# Altium schematic sheet Main.SchDoc
size A4; SheetNumber: 4; SheetTotal: 12
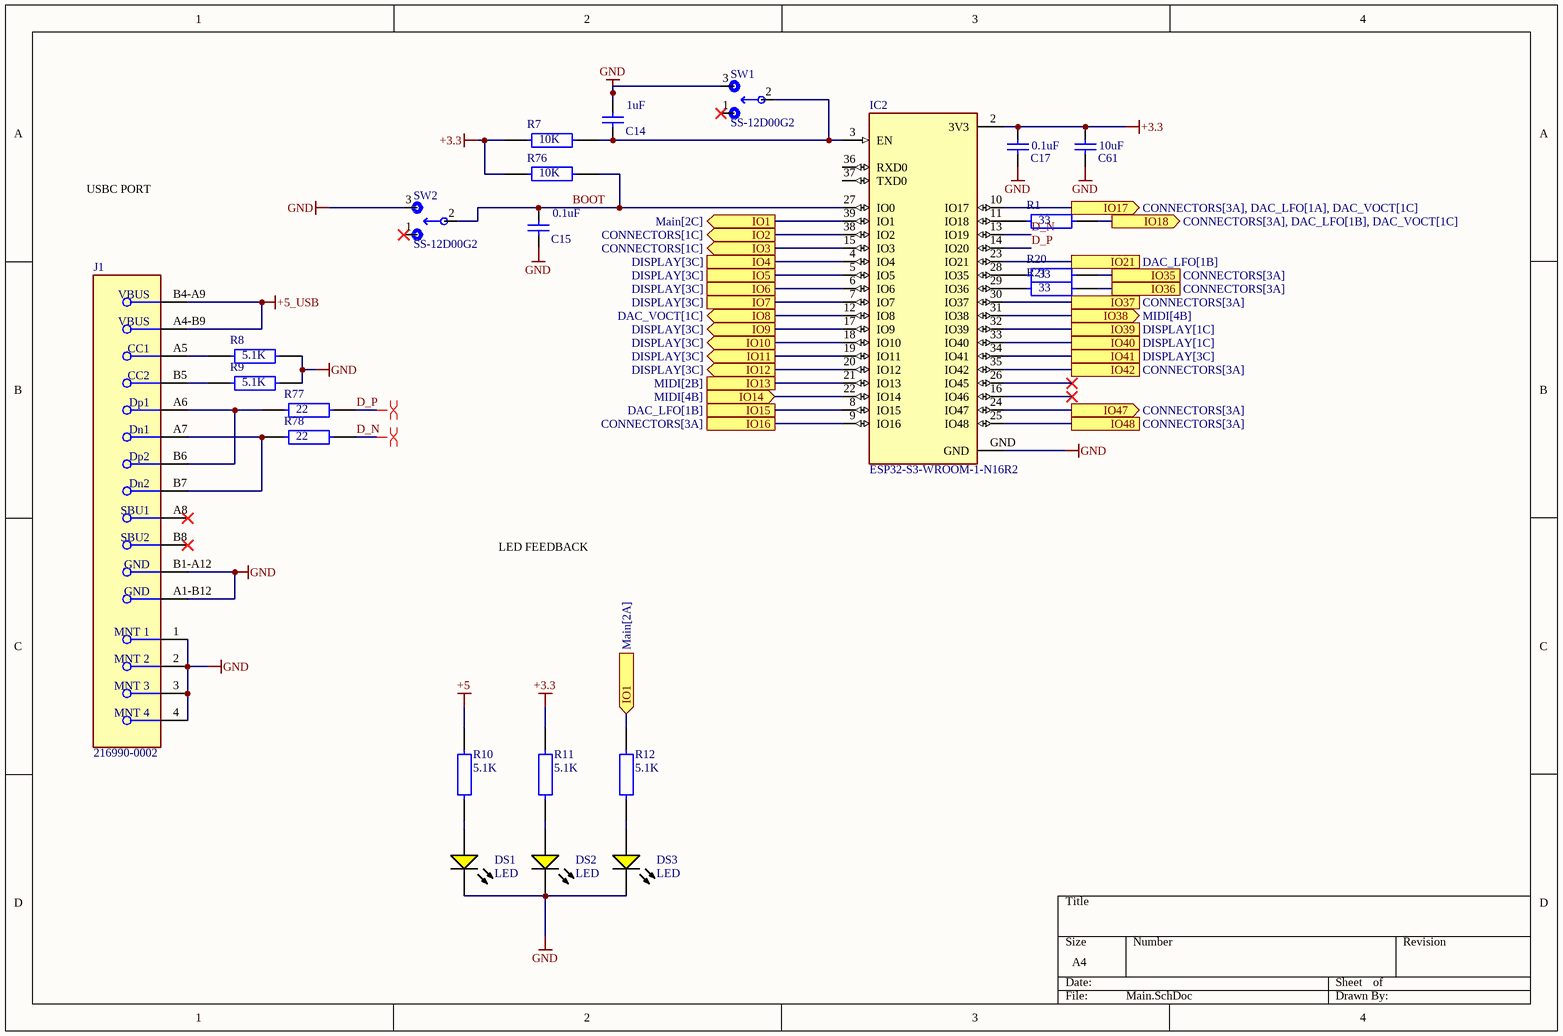
[diagram p0: Main.SchDoc]

## Parts
C14  1uF  [CAPC2013X145X48NL20T23]
C15  0.1uF  [CAPC2013X145X48NL20T23]
C17  0.1uF  [CAPC2013X145X48NL20T23]
C61  10uF  [CAPC2013X145X48NL20T23]
DS1  LED  [LED_0805]
DS2  LED  [LED_0805]
DS3  LED  [LED_0805]
IC2  ESP32-S3-WROOM-1-N16R2  [XCVR_ESP32-S3-WROOM-1-N16R2]
J1  216990-0002  [FP-216990-0002-MFG]
R1  33  [FP-RN73R2A-IPC_A]
R7  10K  [FP-RN73R2A-IPC_A]
R8  5.1K  [FP-RN73R2A-IPC_A]
R9  5.1K  [FP-RN73R2A-IPC_A]
R10  5.1K  [FP-RN73R2A-IPC_A]
R11  5.1K  [FP-RN73R2A-IPC_A]
R12  5.1K  [FP-RN73R2A-IPC_A]
R20  33  [FP-RN73R2A-IPC_A]
R21  33  [FP-RN73R2A-IPC_A]
R76  10K  [FP-RN73R2A-IPC_A]
R77  22  [FP-RN73R2A-IPC_A]
R78  22  [FP-RN73R2A-IPC_A]
SW1  SS-12D00G2  [SS12D00_SPDT]
SW2  SS-12D00G2  [SS12D00_SPDT]

## Ports
IO1 (in, see Main[2A]), IO1 (out, see Main[2C]), IO2 (out, see CONNECTORS[1C]), IO3 (out, see CONNECTORS[1C]), IO4 (see DISPLAY[3C]), IO5 (see DISPLAY[3C]), IO6 (see DISPLAY[3C]), IO7 (see DISPLAY[3C]), IO8 (out, see DAC_VOCT[1C]), IO9 (out, see DISPLAY[3C]), IO10 (out, see DISPLAY[3C]), IO11 (out, see DISPLAY[3C]), IO12 (out, see DISPLAY[3C]), IO13 (see MIDI[2B]), IO14 (in, see MIDI[4B]), IO15 (see DAC_LFO[1B]), IO16 (see CONNECTORS[3A]), IO17 (out, see CONNECTORS[3A], DAC_LFO[1A], DAC_VOCT[1C]), IO18 (out, see CONNECTORS[3A], DAC_LFO[1B], DAC_VOCT[1C]), IO21 (see DAC_LFO[1B]), IO35 (see CONNECTORS[3A]), IO36 (see CONNECTORS[3A]), IO37 (see CONNECTORS[3A]), IO38 (out, see MIDI[4B]), IO39 (see DISPLAY[1C]), IO40 (see DISPLAY[1C]), IO41 (see DISPLAY[3C]), IO42 (see CONNECTORS[3A]), IO47 (out, see CONNECTORS[3A]), IO48 (see CONNECTORS[3A])

## Nets
+3.3: C17.2 C61.2 IC2.2(3V3) R7.2 R11.1 R76.2
+5: R10.1
+5_USB: J1.A4-B9(VBUS) J1.B4-A9(VBUS)
GND: C14.2 C15.1 C17.1 C61.1 DS1.2(K) DS2.2(K) DS3.2(K) IC2.GND J1.1(MNT_1) J1.2(MNT_2) J1.3(MNT_3) J1.4(MNT_4) J1.A1-B12(GND) J1.B1-A12(GND) R8.1 R9.1 SW1.3 SW2.3
BOOT: C15.2 IC2.27(IO0) R76.1 SW2.2
D_N: IC2.13(IO19) R78.1
D_P: IC2.14(IO20) R77.1
IO1: IC2.39(IO1) R12.1 ; port IO1
IO2: IC2.38(IO2) ; port IO2
IO3: IC2.15(IO3) ; port IO3
IO4: IC2.4(IO4) ; port IO4
IO5: IC2.5(IO5) ; port IO5
IO6: IC2.6(IO6) ; port IO6
IO7: IC2.7(IO7) ; port IO7
IO8: IC2.12(IO8) ; port IO8
IO9: IC2.17(IO9) ; port IO9
IO10: IC2.18(IO10) ; port IO10
IO11: IC2.19(IO11) ; port IO11
IO12: IC2.20(IO12) ; port IO12
IO13: IC2.21(IO13) ; port IO13
IO14: IC2.22(IO14) ; port IO14
IO15: IC2.8(IO15) ; port IO15
IO16: IC2.9(IO16) ; port IO16
IO17: IC2.10(IO17) ; port IO17
IO18: R1.1 ; port IO18
IO21: IC2.23(IO21) ; port IO21
IO35: R20.1 ; port IO35
IO36: R21.1 ; port IO36
IO37: IC2.30(IO37) ; port IO37
IO38: IC2.31(IO38) ; port IO38
IO39: IC2.32(IO39) ; port IO39
IO40: IC2.33(IO40) ; port IO40
IO41: IC2.34(IO41) ; port IO41
IO42: IC2.35(IO42) ; port IO42
IO47: IC2.24(IO47) ; port IO47
IO48: IC2.25(IO48) ; port IO48
NetC14_1: C14.1 IC2.3(EN) R7.1 SW1.2
NetDS1_1: DS1.1(A) R10.2
NetDS2_1: DS2.1(A) R11.2
NetDS3_1: DS3.1(A) R12.2
NetIC2_11: IC2.11(IO18) R1.2
NetIC2_28: IC2.28(IO35) R20.2
NetIC2_29: IC2.29(IO36) R21.2
NetJ1_A5: J1.A5(CC1) R8.2
NetJ1_A6: J1.A6(Dp1) J1.B6(Dp2) R77.2
NetJ1_A7: J1.A7(Dn1) J1.B7(Dn2) R78.2
NetJ1_B5: J1.B5(CC2) R9.2

Not connected (* = marked no-connect by the designer): IC2 16(IO46)* 26(IO45)* 36(RXD0) 37(TXD0); J1 A8(SBU1)* B8(SBU2)*; SW1 1*; SW2 1*

## Layout directives
differential pair: D_N, D_P

## Notes on the sheet
- USBC PORT
- LED FEEDBACK

## Library data of the parts
C14 C15 C17 C61 = CAP: Manufacturer: Vitramon; Part Number: VJ0805Y682KXAMT
DS1-DS3 = CMP-1674-00012-1: Through Hole Lamp, 2.1 V, -55 to 100 degC, 2-Pin THD, RoHS, Bulk; Luminous Intensity: 200 mcd; Illumination Colour: White; Power Rating: 78 mW; Viewing Angle: 140 degrees; Lens Style: Diffused; Nominal Vf: 3.6 V; Case\Package: 0603; Forward Current: 20 mA; Colour: White; Pins: 2; Mount: Surface Mount; Min Operating Temperature: -40 degC; Radiation Hardening: No; Width: 0.8 mm; PackageDescription: 2-Pin Through Hole Device, Dia 3.8 mm, Pitch 2.54 mm; REACH SVHC: No SVHC; DatasheetVersion: Rev. B, 07/2013; Max Operating Temperature: 85 degC; PackageReference: LTL-1CHYE; ComponentLink2URL: https://datasheet.ciiva.com/4269/s-110-ltl-1chye-4269126.pdf; ComponentLink1URL: http://www.us.liteon.com/; Case Code (Imperial): 0603; Height: 0.6 mm; Packaging: Tape and Reel; ComponentLink2Description: Datasheet; Length: 1.6 mm; Package Quantity: 4000; RoHSCompliant: true; ComponentLink1Description: Manufacturer URL; Case Code (Metric): 1608; Forward Voltage: 3.6 V
IC2 = ESP32-S3-WROOM-1-N16R2: Bluetooth, WiFi 802.11b/g/n, Bluetooth v5.0 Transceiver Module 2.4GHz PCB Trace Surface Mount; MF: Espressif Systems; MP: ESP32S3WROOM1N16R2; SnapEDA_Link: https://www.snapeda.com/parts/ESP32S3WROOM1N16R2/Espressif+Systems/view-part/?ref=snap; Package: NON STANDARD Espressif Systems; Value: *; Check_prices: https://www.snapeda.com/parts/ESP32S3WROOM1N16R2/Espressif+Systems/view-part/?ref=eda
J1 = USBC16: CONN RCP USB2.0 TYP C 24P SMD RA
R1 R7-R12 R20 R21 R76-R78 = Resistor: RES 10K OHM 0.1% 1/8W 0805
SW1 SW2 = Switch: Switch Slide ON ON SPDT Side Slide 0.1A 12VDC 10000Cycles PC Pins Bracket Mount/Through Hole Bulk; MF: Littelfuse/C&K; MP: OS102011MA1QN1; SnapEDA_Link: https://www.snapeda.com/parts/OS102011MA1QN1/Littelfuse/view-part/?ref=snap; Package: None; Value: *; Check_prices: https://www.snapeda.com/parts/OS102011MA1QN1/Littelfuse/view-part/?ref=eda